# Altium schematic sheet 16_RGBs.SchDoc
size A4; SheetNumber: 3; SheetTotal: 4
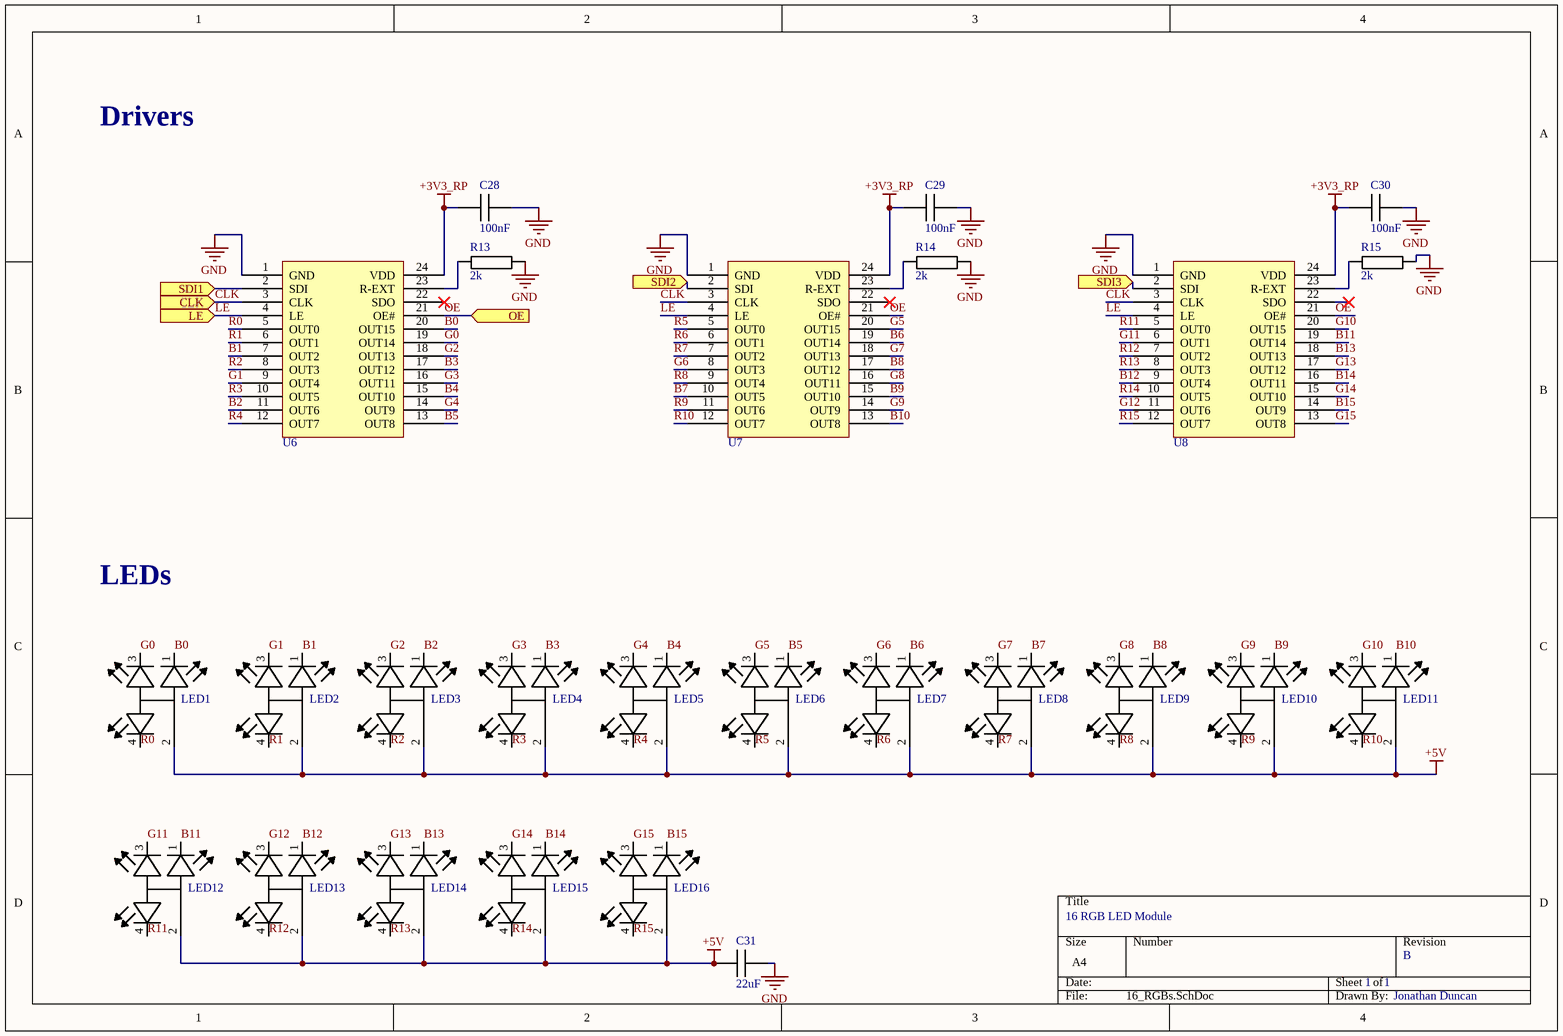
[diagram p0: 16_RGBs.SchDoc]

## Parts
C28  value 100nF  [FP-CC0603-DA-IPC_B]  (hidden comment: Cap 100nF 0603)
C29  value 100nF  [FP-CC0603-DA-IPC_B]  (hidden comment: Cap 100nF 0603)
C30  value 100nF  [FP-CC0603-DA-IPC_B]  (hidden comment: Cap 100nF 0603)
C31  value 22uF  [FP-CC0603-DA-IPC_B]  (hidden comment: Cap 22uF 0603)
LED1  EKINGLUX E6C0606RGBC3UDA  [EKINGLUX E6C0606RGBC3UDA-Footprint-1]  (value not drawn)
LED2  EKINGLUX E6C0606RGBC3UDA  [EKINGLUX E6C0606RGBC3UDA-Footprint-1]  (value not drawn)
LED3  EKINGLUX E6C0606RGBC3UDA  [EKINGLUX E6C0606RGBC3UDA-Footprint-1]  (value not drawn)
LED4  EKINGLUX E6C0606RGBC3UDA  [EKINGLUX E6C0606RGBC3UDA-Footprint-1]  (value not drawn)
LED5  EKINGLUX E6C0606RGBC3UDA  [EKINGLUX E6C0606RGBC3UDA-Footprint-1]  (value not drawn)
LED6  EKINGLUX E6C0606RGBC3UDA  [EKINGLUX E6C0606RGBC3UDA-Footprint-1]  (value not drawn)
LED7  EKINGLUX E6C0606RGBC3UDA  [EKINGLUX E6C0606RGBC3UDA-Footprint-1]  (value not drawn)
LED8  EKINGLUX E6C0606RGBC3UDA  [EKINGLUX E6C0606RGBC3UDA-Footprint-1]  (value not drawn)
LED9  EKINGLUX E6C0606RGBC3UDA  [EKINGLUX E6C0606RGBC3UDA-Footprint-1]  (value not drawn)
LED10  EKINGLUX E6C0606RGBC3UDA  [EKINGLUX E6C0606RGBC3UDA-Footprint-1]  (value not drawn)
LED11  EKINGLUX E6C0606RGBC3UDA  [EKINGLUX E6C0606RGBC3UDA-Footprint-1]  (value not drawn)
LED12  EKINGLUX E6C0606RGBC3UDA  [EKINGLUX E6C0606RGBC3UDA-Footprint-1]  (value not drawn)
LED13  EKINGLUX E6C0606RGBC3UDA  [EKINGLUX E6C0606RGBC3UDA-Footprint-1]  (value not drawn)
LED14  EKINGLUX E6C0606RGBC3UDA  [EKINGLUX E6C0606RGBC3UDA-Footprint-1]  (value not drawn)
LED15  EKINGLUX E6C0606RGBC3UDA  [EKINGLUX E6C0606RGBC3UDA-Footprint-1]  (value not drawn)
LED16  EKINGLUX E6C0606RGBC3UDA  [EKINGLUX E6C0606RGBC3UDA-Footprint-1]  (value not drawn)
R13  value 2k  [FP-RC0603-0_55-IPC_B]  (hidden comment: Res 2k 0603)
R14  value 2k  [FP-RC0603-0_55-IPC_B]  (hidden comment: Res 2k 0603)
R15  value 2k  [FP-RC0603-0_55-IPC_B]  (hidden comment: Res 2k 0603)
U6  Shenzhen Sunmoon Micro SM16206S  [Shenzhen Sunmoon Micro SM16206S-Footprint-1]  (value not drawn)
U7  Shenzhen Sunmoon Micro SM16206S  [Shenzhen Sunmoon Micro SM16206S-Footprint-1]  (value not drawn)
U8  Shenzhen Sunmoon Micro SM16206S  [Shenzhen Sunmoon Micro SM16206S-Footprint-1]  (value not drawn)

## Ports
CLK (in), LE (in), OE (in), SDI1 (in), SDI2 (in), SDI3 (in)

## Nets
+3V3_RP: C28.1 C29.1 C30.1 U6.24(VDD) U7.24(VDD) U8.24(VDD)
+5V: C31.2 LED1.2 LED2.2 LED3.2 LED4.2 LED5.2 LED6.2 LED7.2 LED8.2 LED9.2 LED10.2 LED11.2 LED12.2 LED13.2 LED14.2 LED15.2 LED16.2
GND: C28.2 C29.2 C30.2 C31.1 R13.2 R14.2 R15.2 U6.1(GND) U7.1(GND) U8.1(GND)
B0: LED1.1 U6.20(OUT15)
B1: LED2.1 U6.7(OUT2)
B2: LED3.1 U6.11(OUT6)
B3: LED4.1 U6.17(OUT12)
B4: LED5.1 U6.15(OUT10)
B5: LED6.1 U6.13(OUT8)
B6: LED7.1 U7.19(OUT14)
B7: LED8.1 U7.10(OUT5)
B8: LED9.1 U7.17(OUT12)
B9: LED10.1 U7.15(OUT10)
B10: LED11.1 U7.13(OUT8)
B11: LED12.1 U8.19(OUT14)
B12: LED13.1 U8.9(OUT4)
B13: LED14.1 U8.18(OUT13)
B14: LED15.1 U8.16(OUT11)
B15: LED16.1 U8.14(OUT9)
CLK: U6.3(CLK) U7.3(CLK) U8.3(CLK) ; port CLK
G0: LED1.3 U6.19(OUT14)
G1: LED2.3 U6.9(OUT4)
G2: LED3.3 U6.18(OUT13)
G3: LED4.3 U6.16(OUT11)
G4: LED5.3 U6.14(OUT9)
G5: LED6.3 U7.20(OUT15)
G6: LED7.3 U7.8(OUT3)
G7: LED8.3 U7.18(OUT13)
G8: LED9.3 U7.16(OUT11)
G9: LED10.3 U7.14(OUT9)
G10: LED11.3 U8.20(OUT15)
G11: LED12.3 U8.6(OUT1)
G12: LED13.3 U8.11(OUT6)
G13: LED14.3 U8.17(OUT12)
G14: LED15.3 U8.15(OUT10)
G15: LED16.3 U8.13(OUT8)
LE: U6.4(LE) U7.4(LE) U8.4(LE) ; port LE
OE: U6.21(OE#) U7.21(OE#) U8.21(OE#) ; port OE
R0: LED1.4 U6.5(OUT0)
R1: LED2.4 U6.6(OUT1)
R2: LED3.4 U6.8(OUT3)
R3: LED4.4 U6.10(OUT5)
R4: LED5.4 U6.12(OUT7)
R5: LED6.4 U7.5(OUT0)
R6: LED7.4 U7.6(OUT1)
R7: LED8.4 U7.7(OUT2)
R8: LED9.4 U7.9(OUT4)
R9: LED10.4 U7.11(OUT6)
R10: LED11.4 U7.12(OUT7)
R11: LED12.4 U8.5(OUT0)
R12: LED13.4 U8.7(OUT2)
R13: LED14.4 U8.8(OUT3)
R14: LED15.4 U8.10(OUT5)
R15: LED16.4 U8.12(OUT7)
SDI1: U6.2(SDI) ; port SDI1
SDI2: U7.2(SDI) ; port SDI2
SDI3: U8.2(SDI) ; port SDI3
NetR13_1: R13.1 U6.23(R-EXT)
NetR14_1: R14.1 U7.23(R-EXT)
NetR15_1: R15.1 U8.23(R-EXT)

Not connected (* = marked no-connect by the designer): U6 22(SDO)*; U7 22(SDO)*; U8 22(SDO)*

## Notes on the sheet
- Drivers
- LEDs
- 16 RGB LED Module
- 1
- B
- Jonathan Duncan

## Library data of the parts
C28-C30 = CMP-00006-5: 100nF 50V 10% X7R 0603 SMD Capacitor Decoupling; Temperature Coefficient: X7R; Mounting Technology: SMT; Tolerance: 10%; Case/Package: 0603; Voltage Rating: 50V
C31 = CMP-001-00003-1: 22uF 6.3V 20% X5R 0603 SMD Capacitor; Case/Package: 0603; Mounting Technology: SMT; Voltage Rating: 6.3V; Tolerance: 20%; Temperature Coefficient: X5R
LED1-LED16 = CMP-00018-4: 1.6*1.6*0.6mm RGB SMD CHIP LED
R13-R15 = CMP-009-00018-1: 2k 1% 100mW 0603 SMD Resistor; Mounting Technology: SMT; Tolerance: 1%; Case/Package: 0603; Power Rating: 100mW
U6-U8 = CMP-00010-3: LED constant current driver chip, 16-channel constant current source output, externally adjustable output current, 25MHz clock frequency